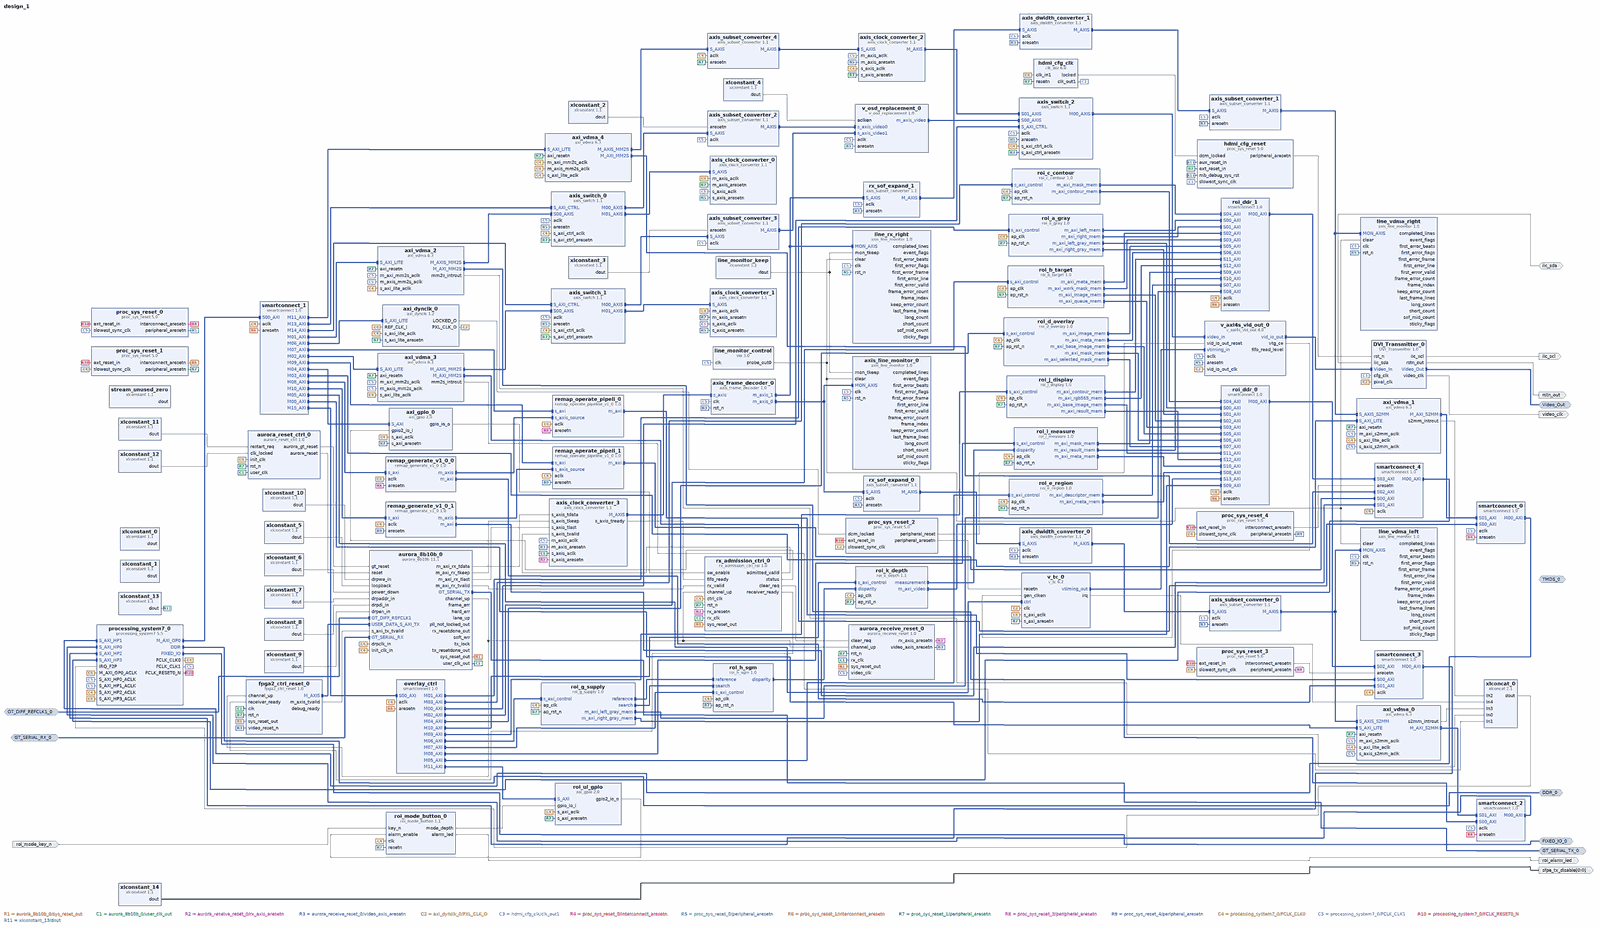
[diagram p0: block diagram of the top level, whole]
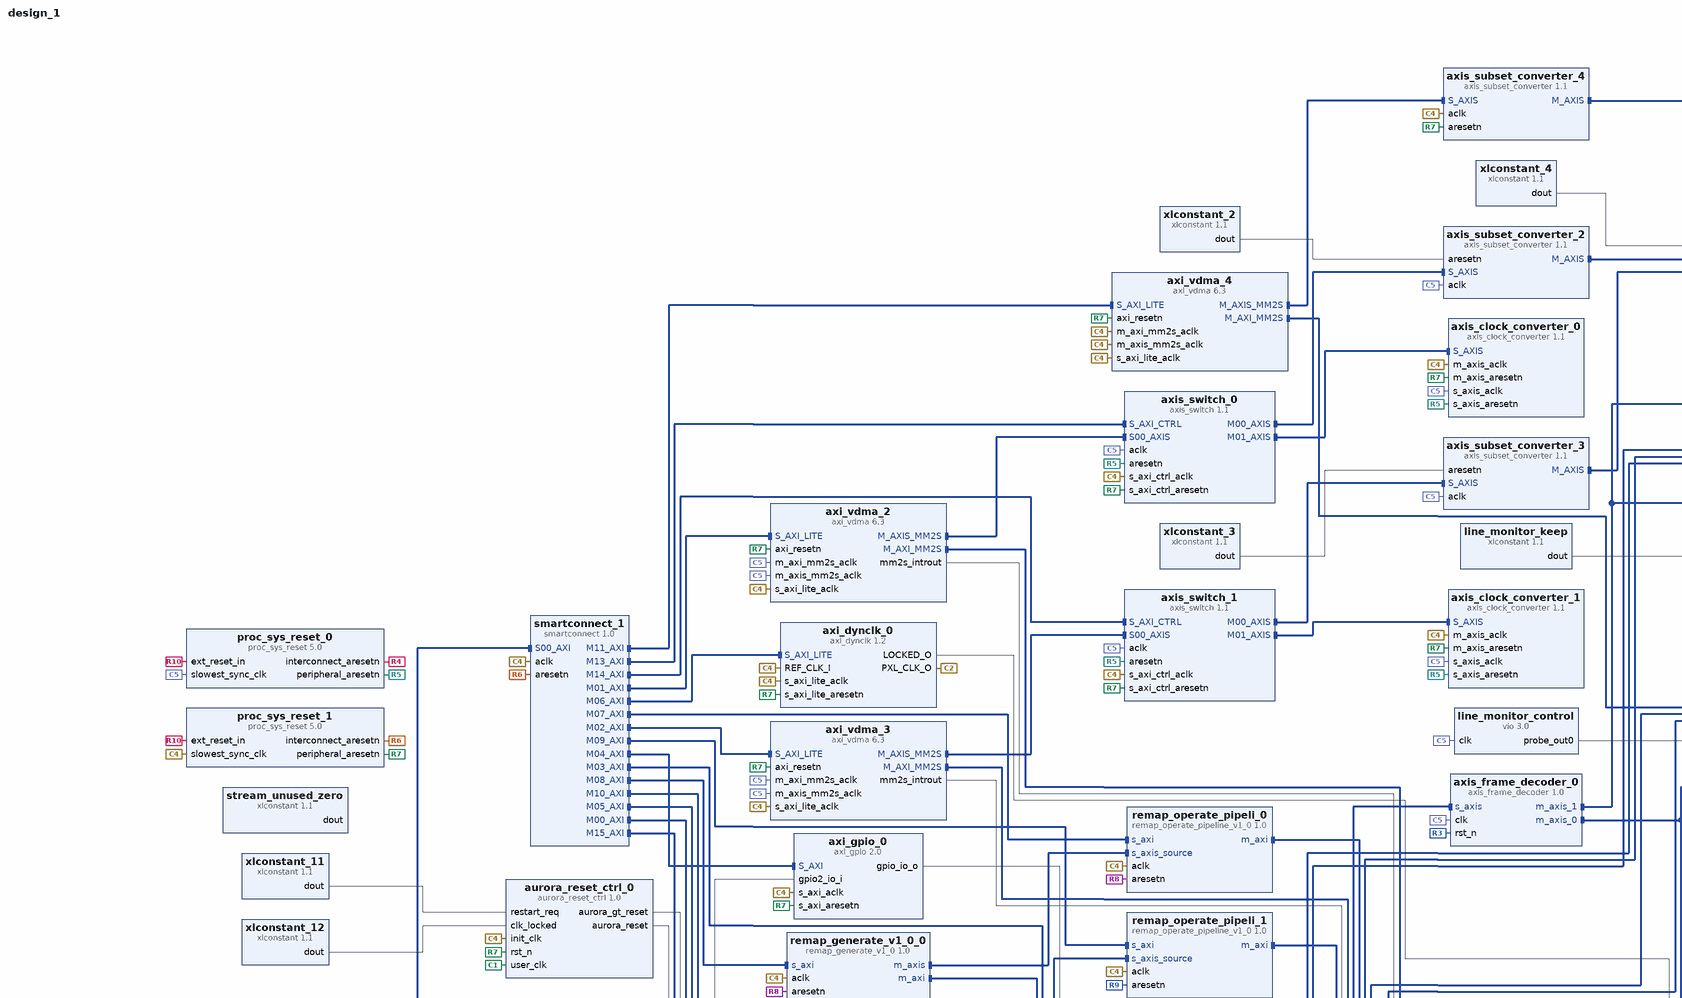
[diagram p1: block diagram of the top level, upper left part]
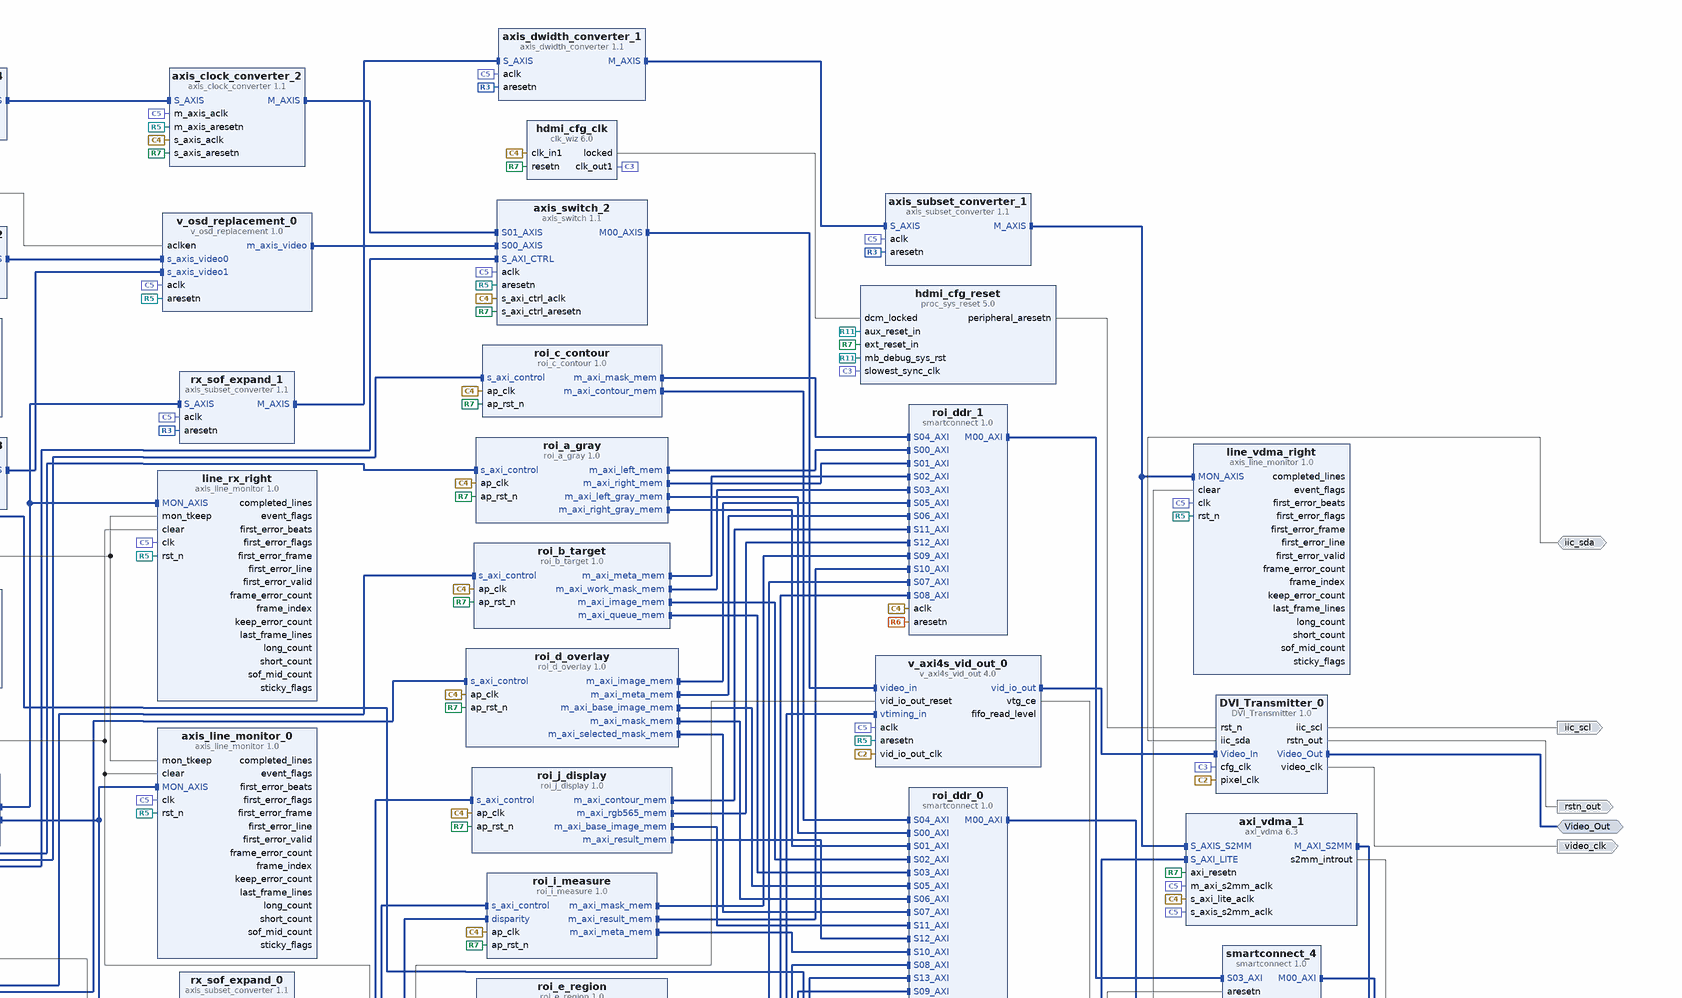
[diagram p2: block diagram of the top level, upper right part]
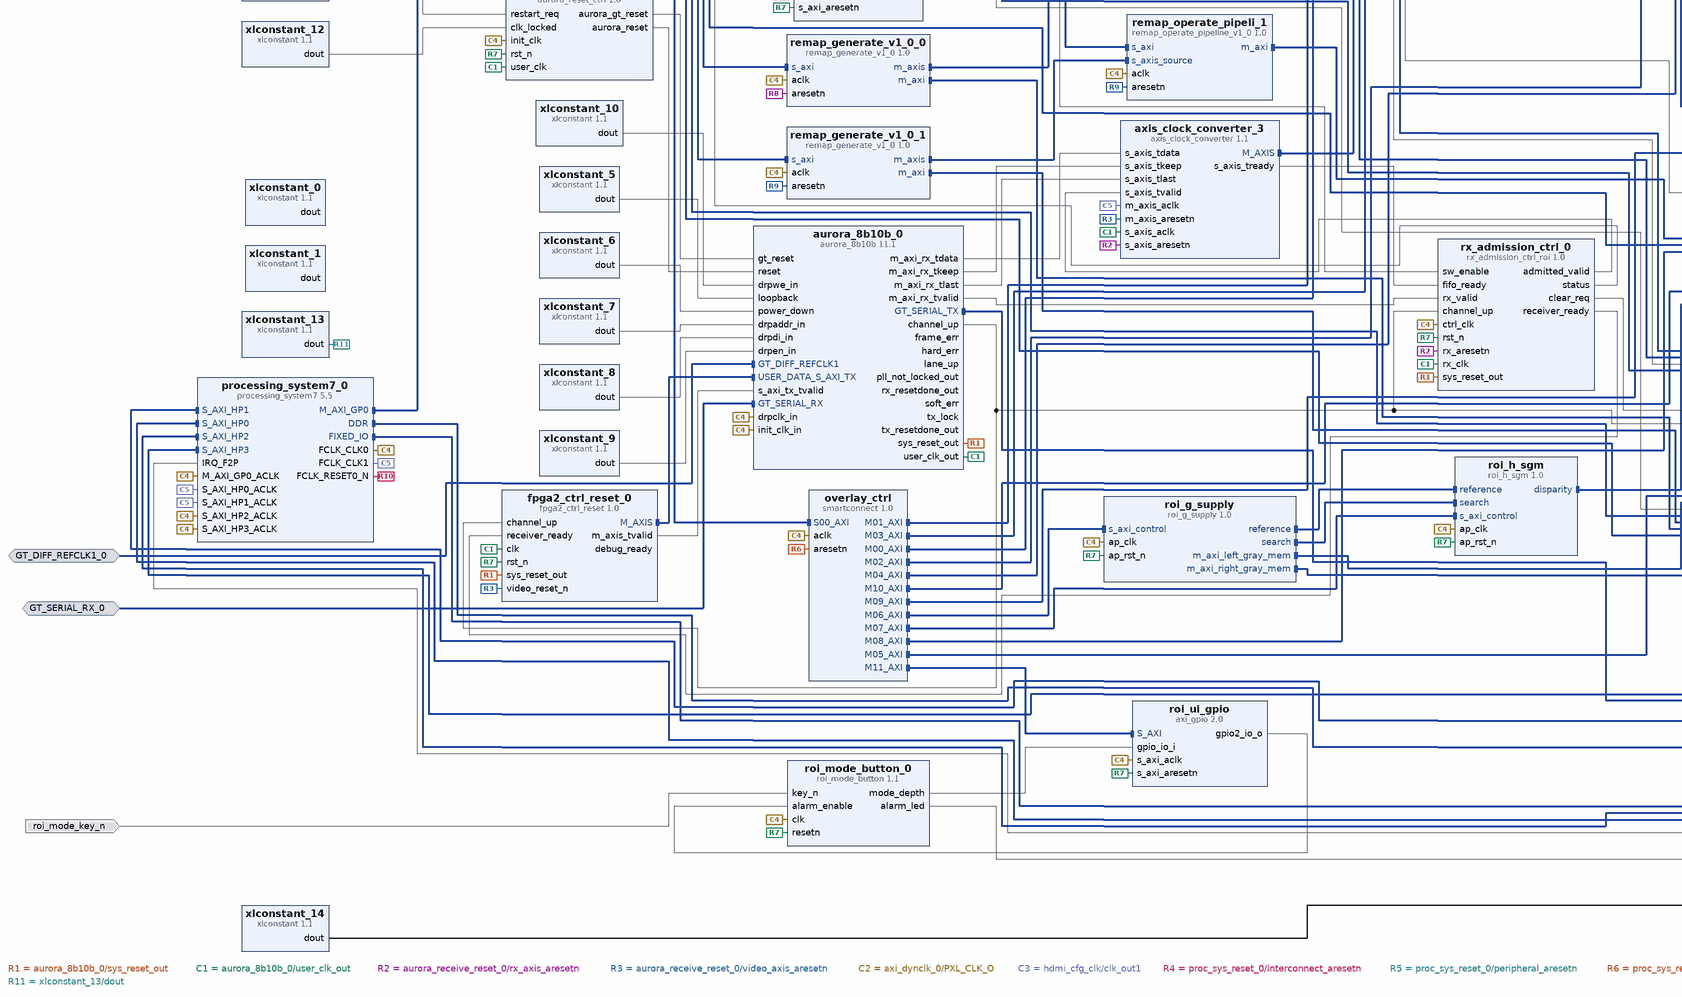
[diagram p3: block diagram of the top level, lower left part]
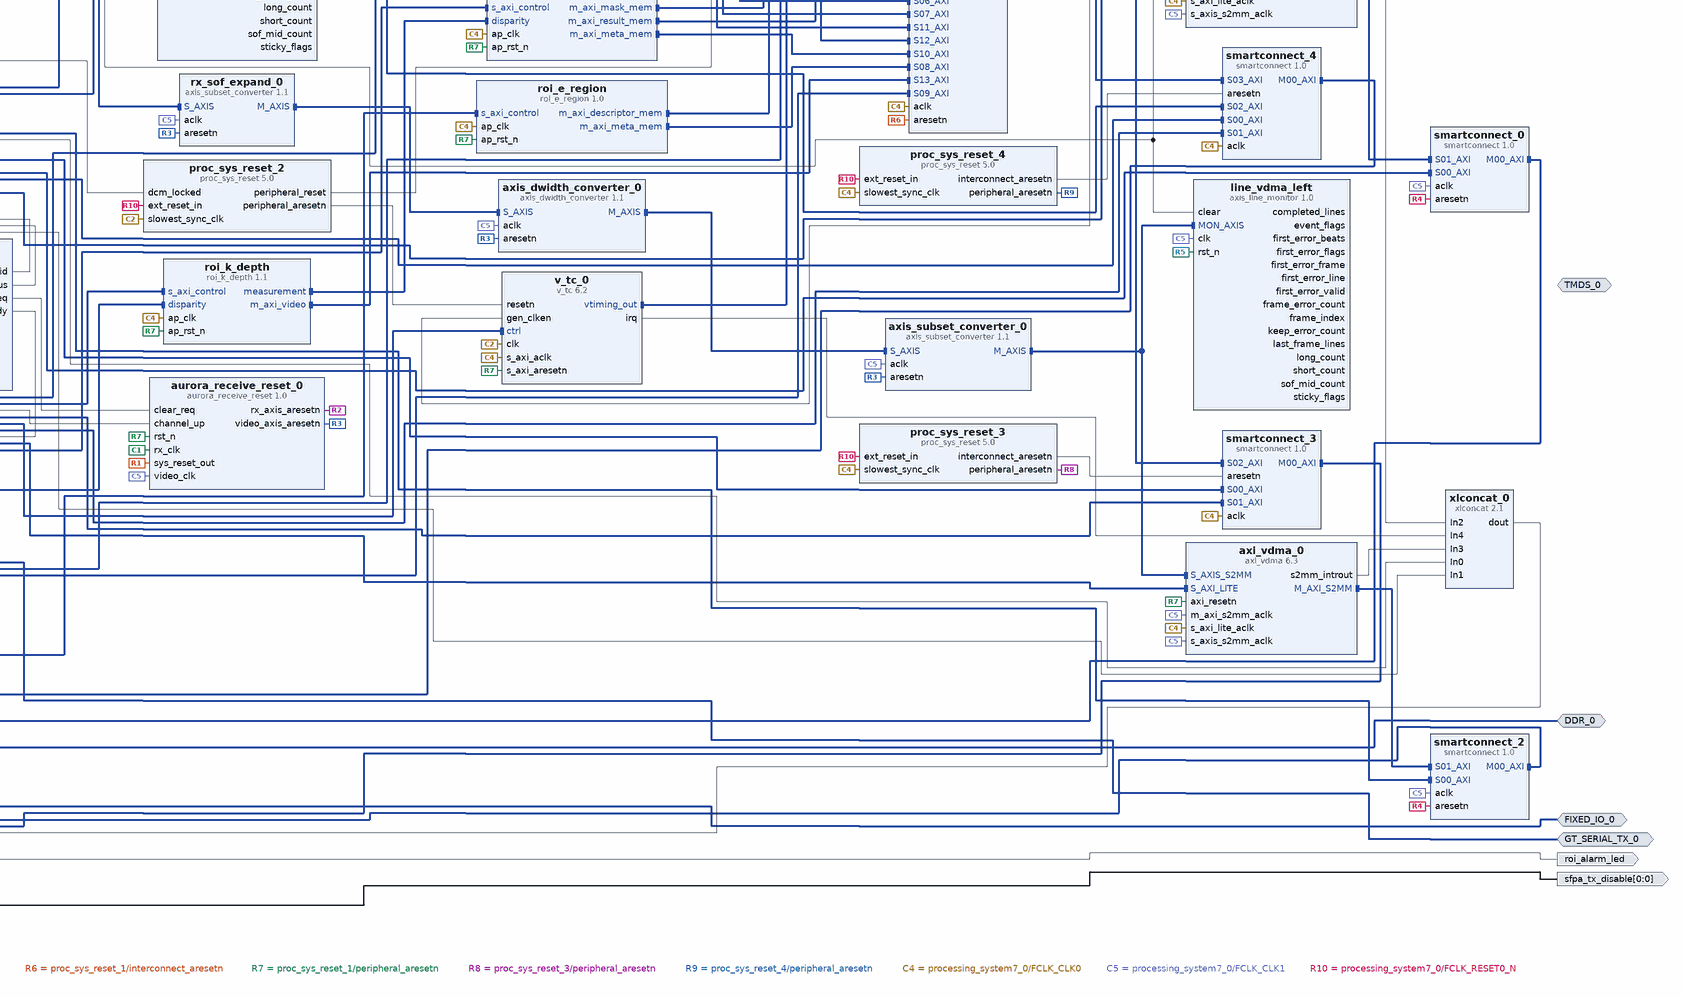
[diagram p4: block diagram of the top level, lower right part]
# Vivado block design design_1, xc7z035ffg900-2, Vivado 2023.2
create_bd_design design_1

create_bd_intf_port -mode Master -vlnv digilentinc.com:interface:tmds_rtl:1.0 TMDS_0
create_bd_intf_port -mode Master -vlnv xilinx.com:display_processing_system7:fixedio_rtl:1.0 FIXED_IO_0
create_bd_intf_port -mode Master -vlnv xilinx.com:interface:ddrx_rtl:1.0 DDR_0
create_bd_intf_port -mode Slave -vlnv xilinx.com:interface:diff_clock_rtl:1.0 GT_DIFF_REFCLK1_0
set_property -dict {CONFIG.FREQ_HZ 156250000} [get_bd_intf_ports GT_DIFF_REFCLK1_0]
create_bd_intf_port -mode Slave -vlnv xilinx.com:display_aurora:GT_Serial_Transceiver_Pins_RX_rtl:1.0 GT_SERIAL_RX_0
create_bd_intf_port -mode Master -vlnv xilinx.com:display_aurora:GT_Serial_Transceiver_Pins_TX_rtl:1.0 GT_SERIAL_TX_0
create_bd_intf_port -mode Master -vlnv xilinx.com:interface:vid_io_rtl:1.0 Video_Out
create_bd_port -dir O -from 0 -to 0 sfpa_tx_disable
create_bd_port -dir O -type clk video_clk
create_bd_port -dir O iic_scl
create_bd_port -dir IO iic_sda
create_bd_port -dir O -type rst rstn_out
create_bd_port -dir I roi_mode_key_n
create_bd_port -dir O roi_alarm_led

create_bd_cell -type ip -vlnv xilinx.com:ip:axis_subset_converter:1.1 axis_subset_converter_0
set_property -dict [list \
  CONFIG.M_TDATA_NUM_BYTES 4 \
  CONFIG.M_TUSER_WIDTH 1 \
  CONFIG.S_TDATA_NUM_BYTES 2 \
  CONFIG.TDATA_REMAP {8'b00000000,tdata[15:11],3'b000,tdata[10:5],2'b00,tdata[4:0],3'b000} \
  CONFIG.TKEEP_REMAP {2'b11,tkeep[1:0]} \
  CONFIG.TLAST_REMAP {tlast[0]} \
  CONFIG.TUSER_REMAP {tuser[0:0]} \
] [get_bd_cells axis_subset_converter_0]
create_bd_cell -type ip -vlnv xilinx.com:ip:axi_vdma:6.3 axi_vdma_0
set_property -dict [list \
  CONFIG.c_include_mm2s 0 \
  CONFIG.c_m_axi_s2mm_data_width 32 \
  CONFIG.c_s2mm_genlock_mode 0 \
  CONFIG.c_s2mm_linebuffer_depth 1024 \
  CONFIG.c_use_s2mm_fsync 0 \
] [get_bd_cells axi_vdma_0]
create_bd_cell -type ip -vlnv xilinx.com:ip:processing_system7:5.5 processing_system7_0
set_property -dict [list \
  CONFIG.PCW_APU_PERIPHERAL_FREQMHZ 666.666666 \
  CONFIG.PCW_CPU_CPU_6X4X_MAX_RANGE 800 \
  CONFIG.PCW_ENET0_PERIPHERAL_ENABLE 0 \
  CONFIG.PCW_EN_CLK1_PORT 1 \
  CONFIG.PCW_FCLK_CLK1_BUF TRUE \
  CONFIG.PCW_FPGA0_PERIPHERAL_FREQMHZ 100 \
  CONFIG.PCW_FPGA1_PERIPHERAL_FREQMHZ 150 \
  CONFIG.PCW_FPGA_FCLK1_ENABLE 1 \
  CONFIG.PCW_GPIO_EMIO_GPIO_ENABLE 1 \
  CONFIG.PCW_GPIO_EMIO_GPIO_IO 64 \
  CONFIG.PCW_GPIO_MIO_GPIO_ENABLE 0 \
  CONFIG.PCW_IRQ_F2P_INTR 1 \
  CONFIG.PCW_PERIPHERAL_BOARD_PRESET None \
  CONFIG.PCW_PRESET_BANK1_VOLTAGE {LVCMOS 3.3V} \
  CONFIG.PCW_QSPI_PERIPHERAL_ENABLE 0 \
  CONFIG.PCW_SD0_PERIPHERAL_ENABLE 0 \
  CONFIG.PCW_S_AXI_HP0_DATA_WIDTH 32 \
  CONFIG.PCW_S_AXI_HP1_DATA_WIDTH 32 \
  CONFIG.PCW_UART0_PERIPHERAL_ENABLE 1 \
  CONFIG.PCW_UART0_UART0_IO {MIO 14 .. 15} \
  CONFIG.PCW_UART1_PERIPHERAL_ENABLE 0 \
  CONFIG.PCW_UART_PERIPHERAL_FREQMHZ 100 \
  CONFIG.PCW_UIPARAM_DDR_FREQ_MHZ 533.333333 \
  CONFIG.PCW_UIPARAM_DDR_PARTNO {MT41J256M16 RE-125} \
  CONFIG.PCW_USB0_PERIPHERAL_ENABLE 0 \
  CONFIG.PCW_USE_FABRIC_INTERRUPT 1 \
  CONFIG.PCW_USE_S_AXI_HP0 1 \
  CONFIG.PCW_USE_S_AXI_HP1 1 \
  CONFIG.PCW_USE_S_AXI_HP2 1 \
  CONFIG.PCW_USE_S_AXI_HP3 1 \
] [get_bd_cells processing_system7_0]
# 349 more settings of processing_system7_0 are not shown: defaults, MIO pin electricals, DDR timing, and values the tool derives
create_bd_cell -type ip -vlnv xilinx.com:ip:axi_vdma:6.3 axi_vdma_1
set_property -dict [list \
  CONFIG.c_include_mm2s 0 \
  CONFIG.c_include_s2mm 1 \
  CONFIG.c_m_axi_s2mm_data_width 32 \
  CONFIG.c_s2mm_genlock_mode 0 \
  CONFIG.c_s2mm_linebuffer_depth 1024 \
  CONFIG.c_use_s2mm_fsync 0 \
] [get_bd_cells axi_vdma_1]
create_bd_cell -type ip -vlnv xilinx.com:ip:axis_subset_converter:1.1 axis_subset_converter_1
set_property -dict [list \
  CONFIG.M_TDATA_NUM_BYTES 4 \
  CONFIG.M_TUSER_WIDTH 1 \
  CONFIG.S_TDATA_NUM_BYTES 2 \
  CONFIG.TDATA_REMAP {8'b00000000,tdata[15:11],3'b000,tdata[10:5],2'b00,tdata[4:0],3'b000} \
  CONFIG.TKEEP_REMAP {2'b11,tkeep[1:0]} \
  CONFIG.TLAST_REMAP {tlast[0]} \
  CONFIG.TUSER_REMAP {tuser[0:0]} \
] [get_bd_cells axis_subset_converter_1]
create_bd_cell -type ip -vlnv xilinx.com:ip:smartconnect:1.0 smartconnect_0
set_property -dict {CONFIG.NUM_SI 2} [get_bd_cells smartconnect_0]
create_bd_cell -type ip -vlnv xilinx.com:ip:axi_vdma:6.3 axi_vdma_2
set_property -dict [list \
  CONFIG.c_include_mm2s 1 \
  CONFIG.c_include_s2mm 0 \
  CONFIG.c_mm2s_genlock_mode 1 \
  CONFIG.c_mm2s_max_burst_length 64 \
] [get_bd_cells axi_vdma_2]
create_bd_cell -type ip -vlnv xilinx.com:ip:axi_vdma:6.3 axi_vdma_3
set_property -dict [list \
  CONFIG.c_include_s2mm 0 \
  CONFIG.c_mm2s_genlock_mode 1 \
  CONFIG.c_mm2s_max_burst_length 64 \
] [get_bd_cells axi_vdma_3]
create_bd_cell -type ip -vlnv xilinx.com:ip:v_axi4s_vid_out:4.0 v_axi4s_vid_out_0
set_property -dict {CONFIG.C_ADDR_WIDTH 11 CONFIG.C_HAS_ASYNC_CLK 1} [get_bd_cells v_axi4s_vid_out_0]
create_bd_cell -type ip -vlnv xilinx.com:ip:axi_gpio:2.0 axi_gpio_0
set_property -dict [list \
  CONFIG.C_ALL_INPUTS_2 1 \
  CONFIG.C_ALL_OUTPUTS 1 \
  CONFIG.C_DOUT_DEFAULT 0x00000000 \
  CONFIG.C_GPIO2_WIDTH 32 \
  CONFIG.C_GPIO_WIDTH 1 \
  CONFIG.C_IS_DUAL 1 \
] [get_bd_cells axi_gpio_0]
create_bd_cell -type ip -vlnv xilinx.com:ip:proc_sys_reset:5.0 proc_sys_reset_0
create_bd_cell -type ip -vlnv xilinx.com:ip:smartconnect:1.0 smartconnect_1
set_property -dict {CONFIG.NUM_MI 16 CONFIG.NUM_SI 1} [get_bd_cells smartconnect_1]
create_bd_cell -type ip -vlnv xilinx.com:ip:xlconstant:1.1 xlconstant_0
create_bd_cell -type ip -vlnv xilinx.com:ip:xlconstant:1.1 xlconstant_1
create_bd_cell -type ip -vlnv xilinx.com:ip:proc_sys_reset:5.0 proc_sys_reset_1
create_bd_cell -type ip -vlnv digilentinc.com:ip:axi_dynclk:1.2 axi_dynclk_0
create_bd_cell -type ip -vlnv xilinx.com:ip:smartconnect:1.0 smartconnect_2
set_property -dict {CONFIG.NUM_SI 2} [get_bd_cells smartconnect_2]
create_bd_cell -type ip -vlnv xilinx.com:ip:v_tc:6.2 v_tc_0
set_property -dict {CONFIG.enable_detection false} [get_bd_cells v_tc_0]
create_bd_cell -type ip -vlnv xilinx.com:ip:axis_subset_converter:1.1 axis_subset_converter_2
set_property -dict [list \
  CONFIG.M_TDATA_NUM_BYTES 3 \
  CONFIG.S_TDATA_NUM_BYTES 4 \
  CONFIG.TDATA_REMAP {tdata[23:16],tdata[7:0],tdata[15:8]} \
  CONFIG.TKEEP_REMAP {tkeep[2:0]} \
  CONFIG.TLAST_REMAP {tlast[0]} \
  CONFIG.TUSER_REMAP {tuser[0:0]} \
] [get_bd_cells axis_subset_converter_2]
create_bd_cell -type ip -vlnv xilinx.com:ip:axis_subset_converter:1.1 axis_subset_converter_3
set_property -dict [list \
  CONFIG.M_TDATA_NUM_BYTES 3 \
  CONFIG.S_TDATA_NUM_BYTES 4 \
  CONFIG.TDATA_REMAP {tdata[23:16],tdata[7:0],tdata[15:8]} \
  CONFIG.TKEEP_REMAP {tkeep[2:0]} \
  CONFIG.TLAST_REMAP {tlast[0]} \
  CONFIG.TUSER_REMAP {tuser[0:0]} \
] [get_bd_cells axis_subset_converter_3]
create_bd_cell -type ip -vlnv xilinx.com:ip:xlconstant:1.1 xlconstant_2
create_bd_cell -type ip -vlnv xilinx.com:ip:xlconstant:1.1 xlconstant_3
create_bd_cell -type ip -vlnv xilinx.com:ip:xlconcat:2.1 xlconcat_0
set_property -dict {CONFIG.NUM_PORTS 5 CONFIG.dout_width 5} [get_bd_cells xlconcat_0]
create_bd_cell -type ip -vlnv xilinx.com:user:v_osd_replacement:1.0 v_osd_replacement_0
create_bd_cell -type ip -vlnv xilinx.com:ip:xlconstant:1.1 xlconstant_4
create_bd_cell -type ip -vlnv xilinx.com:ip:proc_sys_reset:5.0 proc_sys_reset_2
create_bd_cell -type ip -vlnv xilinx.com:ip:smartconnect:1.0 smartconnect_3
set_property -dict {CONFIG.NUM_SI 3} [get_bd_cells smartconnect_3]
create_bd_cell -type ip -vlnv xilinx.com:ip:proc_sys_reset:5.0 proc_sys_reset_3
create_bd_cell -type ip -vlnv xilinx.com:user:remap_generate_v1_0:1.0 remap_generate_v1_0_0
create_bd_cell -type ip -vlnv xilinx.com:user:remap_operate_pipeline_v1_0:1.0 remap_operate_pipeli_0
create_bd_cell -type ip -vlnv xilinx.com:user:remap_operate_pipeline_v1_0:1.0 remap_operate_pipeli_1
create_bd_cell -type ip -vlnv xilinx.com:user:remap_generate_v1_0:1.0 remap_generate_v1_0_1
create_bd_cell -type ip -vlnv xilinx.com:ip:smartconnect:1.0 smartconnect_4
set_property -dict {CONFIG.NUM_SI 4} [get_bd_cells smartconnect_4]
create_bd_cell -type ip -vlnv xilinx.com:ip:proc_sys_reset:5.0 proc_sys_reset_4
create_bd_cell -type ip -vlnv xilinx.com:ip:axis_clock_converter:1.1 axis_clock_converter_0
create_bd_cell -type ip -vlnv xilinx.com:ip:axis_clock_converter:1.1 axis_clock_converter_1
create_bd_cell -type ip -vlnv xilinx.com:ip:axis_switch:1.1 axis_switch_0
set_property -dict [list \
  CONFIG.DECODER_REG 1 \
  CONFIG.NUM_MI 2 \
  CONFIG.NUM_SI 1 \
  CONFIG.ROUTING_MODE 1 \
  CONFIG.TDATA_NUM_BYTES 4 \
] [get_bd_cells axis_switch_0]
create_bd_cell -type ip -vlnv xilinx.com:ip:axis_switch:1.1 axis_switch_1
set_property -dict [list \
  CONFIG.DECODER_REG 1 \
  CONFIG.NUM_MI 2 \
  CONFIG.NUM_SI 1 \
  CONFIG.ROUTING_MODE 1 \
  CONFIG.TDATA_NUM_BYTES 4 \
] [get_bd_cells axis_switch_1]
create_bd_cell -type ip -vlnv xilinx.com:ip:axi_vdma:6.3 axi_vdma_4
set_property -dict [list \
  CONFIG.c_include_s2mm 0 \
  CONFIG.c_m_axis_mm2s_tdata_width 16 \
  CONFIG.c_mm2s_genlock_mode 0 \
  CONFIG.c_mm2s_max_burst_length 64 \
] [get_bd_cells axi_vdma_4]
create_bd_cell -type ip -vlnv xilinx.com:ip:axis_clock_converter:1.1 axis_clock_converter_2
create_bd_cell -type ip -vlnv xilinx.com:ip:axis_subset_converter:1.1 axis_subset_converter_4
set_property -dict [list \
  CONFIG.M_TDATA_NUM_BYTES 3 \
  CONFIG.S_TDATA_NUM_BYTES 2 \
  CONFIG.TDATA_REMAP {tdata[15:11],tdata[15:13],tdata[10:5],tdata[10:9],tdata[4:0],tdata[4:2]} \
  CONFIG.TLAST_REMAP {tlast[0]} \
  CONFIG.TUSER_REMAP {tuser[0:0]} \
] [get_bd_cells axis_subset_converter_4]
create_bd_cell -type ip -vlnv xilinx.com:ip:axis_switch:1.1 axis_switch_2
set_property -dict {CONFIG.ROUTING_MODE 1} [get_bd_cells axis_switch_2]
create_bd_cell -type ip -vlnv xilinx.com:ip:aurora_8b10b:11.1 aurora_8b10b_0
set_property -dict [list \
  CONFIG.C_DRP_IF true \
  CONFIG.C_LANE_WIDTH 4 \
  CONFIG.C_LINE_RATE 2.5 \
  CONFIG.C_REFCLK_FREQUENCY 156.250 \
  CONFIG.SINGLEEND_INITCLK true \
  CONFIG.SupportLevel 1 \
] [get_bd_cells aurora_8b10b_0]
create_bd_cell -type ip -vlnv xilinx.com:user:axis_frame_decoder:1.0 axis_frame_decoder_0
create_bd_cell -type ip -vlnv xilinx.com:ip:axis_clock_converter:1.1 axis_clock_converter_3
set_property -dict {CONFIG.HAS_TLAST 1 CONFIG.IS_ACLK_ASYNC 1 CONFIG.TDATA_NUM_BYTES 4} [get_bd_cells axis_clock_converter_3]
create_bd_cell -type ip -vlnv xilinx.com:user:aurora_reset_ctrl:1.0 aurora_reset_ctrl_0
create_bd_cell -type ip -vlnv xilinx.com:ip:xlconstant:1.1 xlconstant_5
set_property -dict {CONFIG.CONST_VAL 0 CONFIG.CONST_WIDTH 3} [get_bd_cells xlconstant_5]
create_bd_cell -type ip -vlnv xilinx.com:ip:xlconstant:1.1 xlconstant_6
set_property -dict {CONFIG.CONST_VAL 0} [get_bd_cells xlconstant_6]
create_bd_cell -type ip -vlnv xilinx.com:ip:xlconstant:1.1 xlconstant_7
set_property -dict {CONFIG.CONST_VAL 0 CONFIG.CONST_WIDTH 9} [get_bd_cells xlconstant_7]
create_bd_cell -type ip -vlnv xilinx.com:ip:xlconstant:1.1 xlconstant_8
set_property -dict {CONFIG.CONST_VAL 0 CONFIG.CONST_WIDTH 16} [get_bd_cells xlconstant_8]
create_bd_cell -type ip -vlnv xilinx.com:ip:xlconstant:1.1 xlconstant_9
set_property -dict {CONFIG.CONST_VAL 0} [get_bd_cells xlconstant_9]
create_bd_cell -type ip -vlnv xilinx.com:ip:xlconstant:1.1 xlconstant_10
set_property -dict {CONFIG.CONST_VAL 0} [get_bd_cells xlconstant_10]
create_bd_cell -type ip -vlnv xilinx.com:ip:xlconstant:1.1 xlconstant_11
set_property -dict {CONFIG.CONST_VAL 0} [get_bd_cells xlconstant_11]
create_bd_cell -type ip -vlnv xilinx.com:ip:xlconstant:1.1 xlconstant_12
create_bd_cell -type ip -vlnv xilinx.com:user:aurora_receive_reset:1.0 aurora_receive_reset_0
create_bd_cell -type ip -vlnv xilinx.com:ip:xlconstant:1.1 xlconstant_13
set_property -dict {CONFIG.CONST_VAL 0} [get_bd_cells xlconstant_13]
create_bd_cell -type ip -vlnv xilinx.com:ip:axis_dwidth_converter:1.1 axis_dwidth_converter_0
set_property -dict [list \
  CONFIG.HAS_TKEEP 1 \
  CONFIG.HAS_TLAST 1 \
  CONFIG.M_TDATA_NUM_BYTES 2 \
  CONFIG.S_TDATA_NUM_BYTES 4 \
  CONFIG.TUSER_BITS_PER_BYTE 1 \
] [get_bd_cells axis_dwidth_converter_0]
create_bd_cell -type ip -vlnv xilinx.com:ip:axis_dwidth_converter:1.1 axis_dwidth_converter_1
set_property -dict [list \
  CONFIG.HAS_TKEEP 1 \
  CONFIG.HAS_TLAST 1 \
  CONFIG.M_TDATA_NUM_BYTES 2 \
  CONFIG.S_TDATA_NUM_BYTES 4 \
  CONFIG.TUSER_BITS_PER_BYTE 1 \
] [get_bd_cells axis_dwidth_converter_1]
create_bd_cell -type ip -vlnv xilinx.com:ip:xlconstant:1.1 xlconstant_14
set_property -dict {CONFIG.CONST_VAL 0} [get_bd_cells xlconstant_14]
create_bd_cell -type ip -vlnv openedv.com:user:DVI_Transmitter:1.0 DVI_Transmitter_0
create_bd_cell -type ip -vlnv xilinx.com:ip:clk_wiz:6.0 hdmi_cfg_clk
set_property -dict [list \
  CONFIG.CLKOUT1_REQUESTED_OUT_FREQ 10.000 \
  CONFIG.PRIM_IN_FREQ 100.000 \
  CONFIG.PRIM_SOURCE No_buffer \
  CONFIG.RESET_TYPE ACTIVE_LOW \
] [get_bd_cells hdmi_cfg_clk]
create_bd_cell -type ip -vlnv xilinx.com:ip:proc_sys_reset:5.0 hdmi_cfg_reset
set_property -dict {CONFIG.C_AUX_RESET_HIGH 1} [get_bd_cells hdmi_cfg_reset]
create_bd_cell -type ip -vlnv xilinx.com:ip:axis_subset_converter:1.1 rx_sof_expand_0
set_property -dict [list \
  CONFIG.M_HAS_TLAST 1 \
  CONFIG.M_TDATA_NUM_BYTES 4 \
  CONFIG.M_TUSER_WIDTH 4 \
  CONFIG.S_HAS_TLAST 1 \
  CONFIG.S_TDATA_NUM_BYTES 4 \
  CONFIG.S_TUSER_WIDTH 1 \
  CONFIG.TUSER_REMAP {3'b000,tuser[0]} \
] [get_bd_cells rx_sof_expand_0]
create_bd_cell -type ip -vlnv xilinx.com:ip:axis_subset_converter:1.1 rx_sof_expand_1
set_property -dict [list \
  CONFIG.M_HAS_TLAST 1 \
  CONFIG.M_TDATA_NUM_BYTES 4 \
  CONFIG.M_TUSER_WIDTH 4 \
  CONFIG.S_HAS_TLAST 1 \
  CONFIG.S_TDATA_NUM_BYTES 4 \
  CONFIG.S_TUSER_WIDTH 1 \
  CONFIG.TUSER_REMAP {3'b000,tuser[0]} \
] [get_bd_cells rx_sof_expand_1]
create_bd_cell -type ip -vlnv xilinx.com:ip:vio:3.0 line_monitor_control
set_property -dict [list \
  CONFIG.C_NUM_PROBE_IN 0 \
  CONFIG.C_NUM_PROBE_OUT 1 \
  CONFIG.C_PROBE_OUT0_INIT_VAL 0000 \
  CONFIG.C_PROBE_OUT0_WIDTH 1 \
] [get_bd_cells line_monitor_control]
create_bd_cell -type ip -vlnv xilinx.com:ip:xlconstant:1.1 line_monitor_keep
set_property -dict {CONFIG.CONST_VAL 15 CONFIG.CONST_WIDTH 4} [get_bd_cells line_monitor_keep]
create_bd_cell -type ip -vlnv user.org:user:axis_line_monitor:1.0 axis_line_monitor_0
set_property -dict [list \
  CONFIG.CHECK_KEEP 0 \
  CONFIG.DATA_BYTES 4 \
  CONFIG.EXPECTED_BEATS 640 \
  CONFIG.EXPECTED_LINES 720 \
  CONFIG.IDLE_TIMEOUT_CYCLES 0 \
  CONFIG.USER_WIDTH 1 \
] [get_bd_cells axis_line_monitor_0]
create_bd_cell -type ip -vlnv user.org:user:axis_line_monitor:1.0 line_rx_right
set_property -dict [list \
  CONFIG.CHECK_KEEP 0 \
  CONFIG.DATA_BYTES 4 \
  CONFIG.EXPECTED_BEATS 640 \
  CONFIG.EXPECTED_LINES 720 \
  CONFIG.IDLE_TIMEOUT_CYCLES 0 \
  CONFIG.USER_WIDTH 1 \
] [get_bd_cells line_rx_right]
create_bd_cell -type ip -vlnv user.org:user:axis_line_monitor:1.0 line_vdma_left
set_property -dict [list \
  CONFIG.CHECK_KEEP 1 \
  CONFIG.DATA_BYTES 4 \
  CONFIG.EXPECTED_BEATS 1280 \
  CONFIG.EXPECTED_LINES 720 \
  CONFIG.IDLE_TIMEOUT_CYCLES 0 \
  CONFIG.USER_WIDTH 1 \
] [get_bd_cells line_vdma_left]
create_bd_cell -type ip -vlnv user.org:user:axis_line_monitor:1.0 line_vdma_right
set_property -dict [list \
  CONFIG.CHECK_KEEP 1 \
  CONFIG.DATA_BYTES 4 \
  CONFIG.EXPECTED_BEATS 1280 \
  CONFIG.EXPECTED_LINES 720 \
  CONFIG.IDLE_TIMEOUT_CYCLES 0 \
  CONFIG.USER_WIDTH 1 \
] [get_bd_cells line_vdma_right]
create_bd_cell -type ip -vlnv xilinx.com:user:fpga2_ctrl_reset:1.0 fpga2_ctrl_reset_0
create_bd_cell -type ip -vlnv xilinx.com:ip:smartconnect:1.0 overlay_ctrl
set_property -dict {CONFIG.NUM_MI 12 CONFIG.NUM_SI 1} [get_bd_cells overlay_ctrl]
create_bd_cell -type ip -vlnv xilinx.com:ip:xlconstant:1.1 stream_unused_zero
set_property -dict {CONFIG.CONST_VAL 0 CONFIG.CONST_WIDTH 1} [get_bd_cells stream_unused_zero]
create_bd_cell -type ip -vlnv stereo.local:user:roi_a_gray:1.0 roi_a_gray
create_bd_cell -type ip -vlnv stereo.local:user:roi_b_target:1.0 roi_b_target
create_bd_cell -type ip -vlnv stereo.local:user:roi_c_contour:1.0 roi_c_contour
create_bd_cell -type ip -vlnv stereo.local:user:roi_d_overlay:1.0 roi_d_overlay
create_bd_cell -type ip -vlnv stereo.local:user:roi_e_region:1.0 roi_e_region
create_bd_cell -type ip -vlnv stereo.local:user:roi_g_supply:1.0 roi_g_supply
create_bd_cell -type ip -vlnv stereo.local:user:roi_h_sgm:1.0 roi_h_sgm
create_bd_cell -type ip -vlnv stereo.local:user:roi_i_measure:1.0 roi_i_measure
create_bd_cell -type ip -vlnv stereo.local:user:roi_j_display:1.0 roi_j_display
create_bd_cell -type ip -vlnv xilinx.com:ip:smartconnect:1.0 roi_ddr_0
set_property -dict {CONFIG.NUM_MI 1 CONFIG.NUM_SI 14} [get_bd_cells roi_ddr_0]
create_bd_cell -type ip -vlnv xilinx.com:ip:smartconnect:1.0 roi_ddr_1
set_property -dict {CONFIG.NUM_MI 1 CONFIG.NUM_SI 13} [get_bd_cells roi_ddr_1]
create_bd_cell -type ip -vlnv stereo.local:user:rx_admission_ctrl_roi:1.0 rx_admission_ctrl_0
create_bd_cell -type ip -vlnv stereo.local:user:roi_k_depth:1.1 roi_k_depth
create_bd_cell -type ip -vlnv xilinx.com:ip:axi_gpio:2.0 roi_ui_gpio
set_property -dict [list \
  CONFIG.C_ALL_INPUTS 1 \
  CONFIG.C_ALL_OUTPUTS_2 1 \
  CONFIG.C_DOUT_DEFAULT_2 0x00000000 \
  CONFIG.C_GPIO2_WIDTH 1 \
  CONFIG.C_GPIO_WIDTH 2 \
  CONFIG.C_IS_DUAL 1 \
] [get_bd_cells roi_ui_gpio]
create_bd_cell -type ip -vlnv stereo.local:user:roi_mode_button:1.1 roi_mode_button_0

# ---- connections ----

connect_bd_intf_net [get_bd_intf_ports Video_Out] [get_bd_intf_pins DVI_Transmitter_0/Video_Out]
connect_bd_intf_net -intf_net GT_DIFF_REFCLK1_0_1 [get_bd_intf_ports GT_DIFF_REFCLK1_0] [get_bd_intf_pins aurora_8b10b_0/GT_DIFF_REFCLK1]
connect_bd_intf_net -intf_net GT_SERIAL_RX_0_1 [get_bd_intf_ports GT_SERIAL_RX_0] [get_bd_intf_pins aurora_8b10b_0/GT_SERIAL_RX]
connect_bd_intf_net [get_bd_intf_ports GT_SERIAL_TX_0] [get_bd_intf_pins aurora_8b10b_0/GT_SERIAL_TX]
connect_bd_intf_net [get_bd_intf_pins axi_vdma_0/M_AXI_S2MM] [get_bd_intf_pins smartconnect_2/S01_AXI]
connect_bd_intf_net [get_bd_intf_pins axi_vdma_1/M_AXI_S2MM] [get_bd_intf_pins smartconnect_0/S01_AXI]
connect_bd_intf_net [get_bd_intf_pins axi_vdma_2/M_AXIS_MM2S] [get_bd_intf_pins axis_switch_0/S00_AXIS]
connect_bd_intf_net [get_bd_intf_pins axi_vdma_2/M_AXI_MM2S] [get_bd_intf_pins smartconnect_2/S00_AXI]
connect_bd_intf_net [get_bd_intf_pins axi_vdma_3/M_AXIS_MM2S] [get_bd_intf_pins axis_switch_1/S00_AXIS]
connect_bd_intf_net [get_bd_intf_pins axi_vdma_3/M_AXI_MM2S] [get_bd_intf_pins smartconnect_0/S00_AXI]
connect_bd_intf_net [get_bd_intf_pins axi_vdma_4/M_AXIS_MM2S] [get_bd_intf_pins axis_subset_converter_4/S_AXIS]
connect_bd_intf_net [get_bd_intf_pins axi_vdma_4/M_AXI_MM2S] [get_bd_intf_pins smartconnect_4/S02_AXI]
connect_bd_intf_net -intf_net axi_vdma_5_M_AXI_MM2S [get_bd_intf_pins roi_ddr_1/M00_AXI] [get_bd_intf_pins smartconnect_4/S03_AXI]
connect_bd_intf_net [get_bd_intf_pins axis_clock_converter_2/M_AXIS] [get_bd_intf_pins axis_switch_2/S01_AXIS]
connect_bd_intf_net [get_bd_intf_pins axis_clock_converter_3/M_AXIS] [get_bd_intf_pins axis_frame_decoder_0/s_axis]
connect_bd_intf_net [get_bd_intf_pins axis_dwidth_converter_0/M_AXIS] [get_bd_intf_pins axis_subset_converter_0/S_AXIS]
connect_bd_intf_net [get_bd_intf_pins axis_dwidth_converter_1/M_AXIS] [get_bd_intf_pins axis_subset_converter_1/S_AXIS]
connect_bd_intf_net [get_bd_intf_pins axis_frame_decoder_0/m_axis_0] [get_bd_intf_pins rx_sof_expand_0/S_AXIS]
connect_bd_intf_net [get_bd_intf_pins axis_frame_decoder_0/m_axis_0] [get_bd_intf_pins axis_line_monitor_0/MON_AXIS]
connect_bd_intf_net [get_bd_intf_pins axis_frame_decoder_0/m_axis_1] [get_bd_intf_pins rx_sof_expand_1/S_AXIS]
connect_bd_intf_net [get_bd_intf_pins axis_frame_decoder_0/m_axis_1] [get_bd_intf_pins line_rx_right/MON_AXIS]
connect_bd_intf_net [get_bd_intf_pins axis_subset_converter_0/M_AXIS] [get_bd_intf_pins axi_vdma_0/S_AXIS_S2MM]
connect_bd_intf_net [get_bd_intf_pins axis_subset_converter_0/M_AXIS] [get_bd_intf_pins line_vdma_left/MON_AXIS]
connect_bd_intf_net [get_bd_intf_pins axis_subset_converter_1/M_AXIS] [get_bd_intf_pins axi_vdma_1/S_AXIS_S2MM]
connect_bd_intf_net [get_bd_intf_pins axis_subset_converter_1/M_AXIS] [get_bd_intf_pins line_vdma_right/MON_AXIS]
connect_bd_intf_net [get_bd_intf_pins axis_subset_converter_2/M_AXIS] [get_bd_intf_pins v_osd_replacement_0/s_axis_video0]
connect_bd_intf_net [get_bd_intf_pins axis_subset_converter_3/M_AXIS] [get_bd_intf_pins v_osd_replacement_0/s_axis_video1]
connect_bd_intf_net [get_bd_intf_pins axis_subset_converter_4/M_AXIS] [get_bd_intf_pins axis_clock_converter_2/S_AXIS]
connect_bd_intf_net [get_bd_intf_pins axis_switch_0/M00_AXIS] [get_bd_intf_pins axis_subset_converter_2/S_AXIS]
connect_bd_intf_net [get_bd_intf_pins axis_switch_0/M01_AXIS] [get_bd_intf_pins axis_clock_converter_0/S_AXIS]
connect_bd_intf_net [get_bd_intf_pins axis_switch_1/M00_AXIS] [get_bd_intf_pins axis_subset_converter_3/S_AXIS]
connect_bd_intf_net [get_bd_intf_pins axis_switch_1/M01_AXIS] [get_bd_intf_pins axis_clock_converter_1/S_AXIS]
connect_bd_intf_net [get_bd_intf_pins axis_switch_2/M00_AXIS] [get_bd_intf_pins v_axi4s_vid_out_0/video_in]
connect_bd_intf_net [get_bd_intf_pins fpga2_ctrl_reset_0/M_AXIS] [get_bd_intf_pins aurora_8b10b_0/USER_DATA_S_AXI_TX]
connect_bd_intf_net [get_bd_intf_pins overlay_ctrl/M00_AXI] [get_bd_intf_pins axis_switch_2/S_AXI_CTRL]
connect_bd_intf_net [get_bd_intf_pins overlay_ctrl/M01_AXI] [get_bd_intf_pins roi_a_gray/s_axi_control]
connect_bd_intf_net [get_bd_intf_pins overlay_ctrl/M02_AXI] [get_bd_intf_pins roi_b_target/s_axi_control]
connect_bd_intf_net [get_bd_intf_pins overlay_ctrl/M03_AXI] [get_bd_intf_pins roi_c_contour/s_axi_control]
connect_bd_intf_net [get_bd_intf_pins overlay_ctrl/M04_AXI] [get_bd_intf_pins roi_d_overlay/s_axi_control]
connect_bd_intf_net [get_bd_intf_pins overlay_ctrl/M05_AXI] [get_bd_intf_pins roi_e_region/s_axi_control]
connect_bd_intf_net [get_bd_intf_pins overlay_ctrl/M06_AXI] [get_bd_intf_pins roi_g_supply/s_axi_control]
connect_bd_intf_net [get_bd_intf_pins overlay_ctrl/M07_AXI] [get_bd_intf_pins roi_h_sgm/s_axi_control]
connect_bd_intf_net [get_bd_intf_pins overlay_ctrl/M08_AXI] [get_bd_intf_pins roi_i_measure/s_axi_control]
connect_bd_intf_net [get_bd_intf_pins overlay_ctrl/M09_AXI] [get_bd_intf_pins roi_j_display/s_axi_control]
connect_bd_intf_net [get_bd_intf_pins overlay_ctrl/M10_AXI] [get_bd_intf_pins roi_k_depth/s_axi_control]
connect_bd_intf_net [get_bd_intf_pins overlay_ctrl/M11_AXI] [get_bd_intf_pins roi_ui_gpio/S_AXI]
connect_bd_intf_net [get_bd_intf_ports DDR_0] [get_bd_intf_pins processing_system7_0/DDR]
connect_bd_intf_net [get_bd_intf_ports FIXED_IO_0] [get_bd_intf_pins processing_system7_0/FIXED_IO]
connect_bd_intf_net [get_bd_intf_pins processing_system7_0/M_AXI_GP0] [get_bd_intf_pins smartconnect_1/S00_AXI]
connect_bd_intf_net [get_bd_intf_pins remap_generate_v1_0_0/m_axi] [get_bd_intf_pins smartconnect_3/S01_AXI]
connect_bd_intf_net [get_bd_intf_pins remap_operate_pipeli_0/s_axis_source] [get_bd_intf_pins remap_generate_v1_0_0/m_axis]
connect_bd_intf_net [get_bd_intf_pins remap_generate_v1_0_1/m_axi] [get_bd_intf_pins smartconnect_4/S01_AXI]
connect_bd_intf_net [get_bd_intf_pins remap_generate_v1_0_1/m_axis] [get_bd_intf_pins remap_operate_pipeli_1/s_axis_source]
connect_bd_intf_net [get_bd_intf_pins smartconnect_3/S00_AXI] [get_bd_intf_pins remap_operate_pipeli_0/m_axi]
connect_bd_intf_net [get_bd_intf_pins remap_operate_pipeli_1/m_axi] [get_bd_intf_pins smartconnect_4/S00_AXI]
connect_bd_intf_net [get_bd_intf_pins roi_a_gray/m_axi_left_gray_mem] [get_bd_intf_pins roi_ddr_0/S00_AXI]
connect_bd_intf_net [get_bd_intf_pins roi_a_gray/m_axi_left_mem] [get_bd_intf_pins roi_ddr_1/S00_AXI]
connect_bd_intf_net [get_bd_intf_pins roi_a_gray/m_axi_right_gray_mem] [get_bd_intf_pins roi_ddr_0/S01_AXI]
connect_bd_intf_net [get_bd_intf_pins roi_a_gray/m_axi_right_mem] [get_bd_intf_pins roi_ddr_1/S01_AXI]
connect_bd_intf_net [get_bd_intf_pins roi_b_target/m_axi_image_mem] [get_bd_intf_pins roi_ddr_0/S02_AXI]
connect_bd_intf_net [get_bd_intf_pins roi_b_target/m_axi_meta_mem] [get_bd_intf_pins roi_ddr_1/S02_AXI]
connect_bd_intf_net [get_bd_intf_pins roi_b_target/m_axi_queue_mem] [get_bd_intf_pins roi_ddr_0/S03_AXI]
connect_bd_intf_net [get_bd_intf_pins roi_b_target/m_axi_work_mask_mem] [get_bd_intf_pins roi_ddr_1/S03_AXI]
connect_bd_intf_net [get_bd_intf_pins roi_c_contour/m_axi_contour_mem] [get_bd_intf_pins roi_ddr_0/S04_AXI]
connect_bd_intf_net [get_bd_intf_pins roi_c_contour/m_axi_mask_mem] [get_bd_intf_pins roi_ddr_1/S04_AXI]
connect_bd_intf_net [get_bd_intf_pins roi_d_overlay/m_axi_base_image_mem] [get_bd_intf_pins roi_ddr_0/S05_AXI]
connect_bd_intf_net [get_bd_intf_pins roi_d_overlay/m_axi_image_mem] [get_bd_intf_pins roi_ddr_1/S05_AXI]
connect_bd_intf_net [get_bd_intf_pins roi_d_overlay/m_axi_mask_mem] [get_bd_intf_pins roi_ddr_0/S06_AXI]
connect_bd_intf_net [get_bd_intf_pins roi_d_overlay/m_axi_meta_mem] [get_bd_intf_pins roi_ddr_1/S06_AXI]
connect_bd_intf_net [get_bd_intf_pins roi_d_overlay/m_axi_selected_mask_mem] [get_bd_intf_pins roi_ddr_0/S07_AXI]
connect_bd_intf_net [get_bd_intf_pins roi_e_region/m_axi_descriptor_mem] [get_bd_intf_pins roi_ddr_1/S07_AXI]
connect_bd_intf_net [get_bd_intf_pins roi_e_region/m_axi_meta_mem] [get_bd_intf_pins roi_ddr_0/S08_AXI]
connect_bd_intf_net [get_bd_intf_pins roi_g_supply/m_axi_left_gray_mem] [get_bd_intf_pins roi_ddr_1/S08_AXI]
connect_bd_intf_net [get_bd_intf_pins roi_g_supply/m_axi_right_gray_mem] [get_bd_intf_pins roi_ddr_0/S09_AXI]
connect_bd_intf_net [get_bd_intf_pins roi_g_supply/reference] [get_bd_intf_pins roi_h_sgm/reference]
connect_bd_intf_net [get_bd_intf_pins roi_g_supply/search] [get_bd_intf_pins roi_h_sgm/search]
connect_bd_intf_net [get_bd_intf_pins roi_h_sgm/disparity] [get_bd_intf_pins roi_k_depth/disparity]
connect_bd_intf_net [get_bd_intf_pins roi_i_measure/m_axi_mask_mem] [get_bd_intf_pins roi_ddr_1/S09_AXI]
connect_bd_intf_net [get_bd_intf_pins roi_i_measure/m_axi_meta_mem] [get_bd_intf_pins roi_ddr_0/S10_AXI]
connect_bd_intf_net [get_bd_intf_pins roi_i_measure/m_axi_result_mem] [get_bd_intf_pins roi_ddr_1/S10_AXI]
connect_bd_intf_net [get_bd_intf_pins roi_j_display/m_axi_base_image_mem] [get_bd_intf_pins roi_ddr_0/S11_AXI]
connect_bd_intf_net [get_bd_intf_pins roi_j_display/m_axi_contour_mem] [get_bd_intf_pins roi_ddr_1/S11_AXI]
connect_bd_intf_net [get_bd_intf_pins roi_j_display/m_axi_result_mem] [get_bd_intf_pins roi_ddr_0/S12_AXI]
connect_bd_intf_net [get_bd_intf_pins roi_j_display/m_axi_rgb565_mem] [get_bd_intf_pins roi_ddr_1/S12_AXI]
connect_bd_intf_net [get_bd_intf_pins roi_k_depth/m_axi_video] [get_bd_intf_pins roi_ddr_0/S13_AXI]
connect_bd_intf_net [get_bd_intf_pins roi_k_depth/measurement] [get_bd_intf_pins roi_i_measure/disparity]
connect_bd_intf_net [get_bd_intf_pins rx_sof_expand_0/M_AXIS] [get_bd_intf_pins axis_dwidth_converter_0/S_AXIS]
connect_bd_intf_net [get_bd_intf_pins rx_sof_expand_1/M_AXIS] [get_bd_intf_pins axis_dwidth_converter_1/S_AXIS]
connect_bd_intf_net [get_bd_intf_pins smartconnect_0/M00_AXI] [get_bd_intf_pins processing_system7_0/S_AXI_HP1]
connect_bd_intf_net [get_bd_intf_pins smartconnect_1/M00_AXI] [get_bd_intf_pins axi_vdma_0/S_AXI_LITE]
connect_bd_intf_net [get_bd_intf_pins smartconnect_1/M01_AXI] [get_bd_intf_pins axi_vdma_2/S_AXI_LITE]
connect_bd_intf_net [get_bd_intf_pins smartconnect_1/M02_AXI] [get_bd_intf_pins axi_vdma_3/S_AXI_LITE]
connect_bd_intf_net [get_bd_intf_pins smartconnect_1/M03_AXI] [get_bd_intf_pins axi_vdma_1/S_AXI_LITE]
connect_bd_intf_net [get_bd_intf_pins smartconnect_1/M04_AXI] [get_bd_intf_pins axi_gpio_0/S_AXI]
connect_bd_intf_net [get_bd_intf_pins v_tc_0/ctrl] [get_bd_intf_pins smartconnect_1/M05_AXI]
connect_bd_intf_net [get_bd_intf_pins smartconnect_1/M06_AXI] [get_bd_intf_pins axi_dynclk_0/S_AXI_LITE]
connect_bd_intf_net [get_bd_intf_pins smartconnect_1/M07_AXI] [get_bd_intf_pins remap_operate_pipeli_0/s_axi]
connect_bd_intf_net [get_bd_intf_pins smartconnect_1/M08_AXI] [get_bd_intf_pins remap_generate_v1_0_0/s_axi]
connect_bd_intf_net [get_bd_intf_pins smartconnect_1/M09_AXI] [get_bd_intf_pins remap_operate_pipeli_1/s_axi]
connect_bd_intf_net [get_bd_intf_pins smartconnect_1/M10_AXI] [get_bd_intf_pins remap_generate_v1_0_1/s_axi]
connect_bd_intf_net [get_bd_intf_pins smartconnect_1/M11_AXI] [get_bd_intf_pins axi_vdma_4/S_AXI_LITE]
connect_bd_intf_net [get_bd_intf_pins axis_switch_0/S_AXI_CTRL] [get_bd_intf_pins smartconnect_1/M13_AXI]
connect_bd_intf_net [get_bd_intf_pins axis_switch_1/S_AXI_CTRL] [get_bd_intf_pins smartconnect_1/M14_AXI]
connect_bd_intf_net [get_bd_intf_pins smartconnect_1/M15_AXI] [get_bd_intf_pins overlay_ctrl/S00_AXI]
connect_bd_intf_net [get_bd_intf_pins smartconnect_2/M00_AXI] [get_bd_intf_pins processing_system7_0/S_AXI_HP0]
connect_bd_intf_net [get_bd_intf_pins processing_system7_0/S_AXI_HP2] [get_bd_intf_pins smartconnect_3/M00_AXI]
connect_bd_intf_net [get_bd_intf_pins smartconnect_4/M00_AXI] [get_bd_intf_pins processing_system7_0/S_AXI_HP3]
connect_bd_intf_net -intf_net stereo_match_v1_0_0_M_AXI [get_bd_intf_pins roi_ddr_0/M00_AXI] [get_bd_intf_pins smartconnect_3/S02_AXI]
connect_bd_intf_net [get_bd_intf_pins v_axi4s_vid_out_0/vid_io_out] [get_bd_intf_pins DVI_Transmitter_0/Video_In]
connect_bd_intf_net [get_bd_intf_pins v_osd_replacement_0/m_axis_video] [get_bd_intf_pins axis_switch_2/S00_AXIS]
connect_bd_intf_net [get_bd_intf_pins v_tc_0/vtiming_out] [get_bd_intf_pins v_axi4s_vid_out_0/vtiming_in]
connect_bd_net [get_bd_pins DVI_Transmitter_0/iic_scl] [get_bd_ports iic_scl]
connect_bd_net [get_bd_pins DVI_Transmitter_0/rstn_out] [get_bd_ports rstn_out]
connect_bd_net [get_bd_pins DVI_Transmitter_0/video_clk] [get_bd_ports video_clk]
connect_bd_net [get_bd_ports iic_sda] [get_bd_pins DVI_Transmitter_0/iic_sda]
connect_bd_net [get_bd_pins aurora_8b10b_0/m_axi_rx_tdata] [get_bd_pins axis_clock_converter_3/s_axis_tdata]
connect_bd_net [get_bd_pins aurora_8b10b_0/m_axi_rx_tkeep] [get_bd_pins axis_clock_converter_3/s_axis_tkeep]
connect_bd_net [get_bd_pins aurora_8b10b_0/m_axi_rx_tlast] [get_bd_pins axis_clock_converter_3/s_axis_tlast]
connect_bd_net [get_bd_pins aurora_8b10b_0/m_axi_rx_tvalid] [get_bd_pins rx_admission_ctrl_0/rx_valid]
connect_bd_net [get_bd_pins aurora_8b10b_0/sys_reset_out] \
  [get_bd_pins aurora_receive_reset_0/sys_reset_out] [get_bd_pins fpga2_ctrl_reset_0/sys_reset_out] \
  [get_bd_pins rx_admission_ctrl_0/sys_reset_out]
connect_bd_net [get_bd_pins aurora_8b10b_0/user_clk_out] \
  [get_bd_pins axis_clock_converter_3/s_axis_aclk] [get_bd_pins aurora_reset_ctrl_0/user_clk] \
  [get_bd_pins aurora_receive_reset_0/rx_clk] [get_bd_pins fpga2_ctrl_reset_0/clk] [get_bd_pins rx_admission_ctrl_0/rx_clk]
connect_bd_net [get_bd_pins aurora_receive_reset_0/rx_axis_aresetn] \
  [get_bd_pins axis_clock_converter_3/s_axis_aresetn] [get_bd_pins rx_admission_ctrl_0/rx_aresetn]
connect_bd_net [get_bd_pins aurora_receive_reset_0/video_axis_aresetn] \
  [get_bd_pins axis_clock_converter_3/m_axis_aresetn] [get_bd_pins axis_frame_decoder_0/rst_n] \
  [get_bd_pins axis_dwidth_converter_1/aresetn] [get_bd_pins axis_dwidth_converter_0/aresetn] \
  [get_bd_pins axis_subset_converter_0/aresetn] [get_bd_pins axis_subset_converter_1/aresetn] \
  [get_bd_pins rx_sof_expand_0/aresetn] [get_bd_pins rx_sof_expand_1/aresetn] [get_bd_pins fpga2_ctrl_reset_0/video_reset_n]
connect_bd_net [get_bd_pins aurora_reset_ctrl_0/aurora_gt_reset] [get_bd_pins aurora_8b10b_0/gt_reset]
connect_bd_net [get_bd_pins aurora_reset_ctrl_0/aurora_reset] [get_bd_pins aurora_8b10b_0/reset]
connect_bd_net [get_bd_pins axi_dynclk_0/LOCKED_O] [get_bd_pins proc_sys_reset_2/dcm_locked]
connect_bd_net [get_bd_pins axi_dynclk_0/PXL_CLK_O] \
  [get_bd_pins proc_sys_reset_2/slowest_sync_clk] [get_bd_pins v_axi4s_vid_out_0/vid_io_out_clk] [get_bd_pins v_tc_0/clk] \
  [get_bd_pins DVI_Transmitter_0/pixel_clk]
connect_bd_net [get_bd_pins axi_gpio_0/gpio_io_o] [get_bd_pins rx_admission_ctrl_0/sw_enable]
connect_bd_net [get_bd_pins axi_vdma_0/s2mm_introut] [get_bd_pins xlconcat_0/In3]
connect_bd_net [get_bd_pins axi_vdma_1/s2mm_introut] [get_bd_pins xlconcat_0/In2]
connect_bd_net [get_bd_pins axi_vdma_2/mm2s_introut] [get_bd_pins xlconcat_0/In0]
connect_bd_net [get_bd_pins axi_vdma_3/mm2s_introut] [get_bd_pins xlconcat_0/In1]
connect_bd_net [get_bd_pins axis_clock_converter_3/s_axis_tready] [get_bd_pins rx_admission_ctrl_0/fifo_ready]
# net axis_line_monitor_0_completed_lines has one end: axis_line_monitor_0/completed_lines
# net axis_line_monitor_0_event_flags has one end: axis_line_monitor_0/event_flags
# net axis_line_monitor_0_first_error_beats has one end: axis_line_monitor_0/first_error_beats
# net axis_line_monitor_0_first_error_flags has one end: axis_line_monitor_0/first_error_flags
# net axis_line_monitor_0_first_error_frame has one end: axis_line_monitor_0/first_error_frame
# net axis_line_monitor_0_first_error_line has one end: axis_line_monitor_0/first_error_line
# net axis_line_monitor_0_first_error_valid has one end: axis_line_monitor_0/first_error_valid
# net axis_line_monitor_0_frame_error_count has one end: axis_line_monitor_0/frame_error_count
# net axis_line_monitor_0_frame_index has one end: axis_line_monitor_0/frame_index
# net axis_line_monitor_0_keep_error_count has one end: axis_line_monitor_0/keep_error_count
# net axis_line_monitor_0_last_frame_lines has one end: axis_line_monitor_0/last_frame_lines
# net axis_line_monitor_0_long_count has one end: axis_line_monitor_0/long_count
# net axis_line_monitor_0_short_count has one end: axis_line_monitor_0/short_count
# net axis_line_monitor_0_sof_mid_count has one end: axis_line_monitor_0/sof_mid_count
# net axis_line_monitor_0_sticky_flags has one end: axis_line_monitor_0/sticky_flags
connect_bd_net -net channel_up [get_bd_pins aurora_8b10b_0/channel_up] \
  [get_bd_pins aurora_receive_reset_0/channel_up] [get_bd_pins fpga2_ctrl_reset_0/channel_up] \
  [get_bd_pins rx_admission_ctrl_0/channel_up]
# net fifo_read_level has one end: v_axi4s_vid_out_0/fifo_read_level
# net fpga2_ctrl_reset_0_debug_ready has one end: fpga2_ctrl_reset_0/debug_ready
connect_bd_net [get_bd_pins fpga2_ctrl_reset_0/m_axis_tvalid] [get_bd_pins aurora_8b10b_0/s_axi_tx_tvalid]
# net frame_err has one end: aurora_8b10b_0/frame_err
# net hard_err has one end: aurora_8b10b_0/hard_err
connect_bd_net [get_bd_pins hdmi_cfg_clk/clk_out1] [get_bd_pins hdmi_cfg_reset/slowest_sync_clk] [get_bd_pins DVI_Transmitter_0/cfg_clk]
connect_bd_net [get_bd_pins hdmi_cfg_clk/locked] [get_bd_pins hdmi_cfg_reset/dcm_locked]
connect_bd_net [get_bd_pins hdmi_cfg_reset/peripheral_aresetn] [get_bd_pins DVI_Transmitter_0/rst_n]
# net lane_up has one end: aurora_8b10b_0/lane_up
connect_bd_net [get_bd_pins line_monitor_control/probe_out0] \
  [get_bd_pins axis_line_monitor_0/clear] [get_bd_pins line_rx_right/clear] [get_bd_pins line_vdma_left/clear] \
  [get_bd_pins line_vdma_right/clear]
connect_bd_net [get_bd_pins line_monitor_keep/dout] [get_bd_pins axis_line_monitor_0/mon_tkeep] [get_bd_pins line_rx_right/mon_tkeep]
# net line_rx_right_completed_lines has one end: line_rx_right/completed_lines
# net line_rx_right_event_flags has one end: line_rx_right/event_flags
# net line_rx_right_first_error_beats has one end: line_rx_right/first_error_beats
# net line_rx_right_first_error_flags has one end: line_rx_right/first_error_flags
# net line_rx_right_first_error_frame has one end: line_rx_right/first_error_frame
# net line_rx_right_first_error_line has one end: line_rx_right/first_error_line
# net line_rx_right_first_error_valid has one end: line_rx_right/first_error_valid
# net line_rx_right_frame_error_count has one end: line_rx_right/frame_error_count
# net line_rx_right_frame_index has one end: line_rx_right/frame_index
# net line_rx_right_keep_error_count has one end: line_rx_right/keep_error_count
# net line_rx_right_last_frame_lines has one end: line_rx_right/last_frame_lines
# net line_rx_right_long_count has one end: line_rx_right/long_count
# net line_rx_right_short_count has one end: line_rx_right/short_count
# net line_rx_right_sof_mid_count has one end: line_rx_right/sof_mid_count
# net line_rx_right_sticky_flags has one end: line_rx_right/sticky_flags
# net line_vdma_left_completed_lines has one end: line_vdma_left/completed_lines
# net line_vdma_left_event_flags has one end: line_vdma_left/event_flags
# net line_vdma_left_first_error_beats has one end: line_vdma_left/first_error_beats
# net line_vdma_left_first_error_flags has one end: line_vdma_left/first_error_flags
# net line_vdma_left_first_error_frame has one end: line_vdma_left/first_error_frame
# net line_vdma_left_first_error_line has one end: line_vdma_left/first_error_line
# net line_vdma_left_first_error_valid has one end: line_vdma_left/first_error_valid
# net line_vdma_left_frame_error_count has one end: line_vdma_left/frame_error_count
# net line_vdma_left_frame_index has one end: line_vdma_left/frame_index
# net line_vdma_left_keep_error_count has one end: line_vdma_left/keep_error_count
# net line_vdma_left_last_frame_lines has one end: line_vdma_left/last_frame_lines
# net line_vdma_left_long_count has one end: line_vdma_left/long_count
# net line_vdma_left_short_count has one end: line_vdma_left/short_count
# net line_vdma_left_sof_mid_count has one end: line_vdma_left/sof_mid_count
# net line_vdma_left_sticky_flags has one end: line_vdma_left/sticky_flags
# net line_vdma_right_completed_lines has one end: line_vdma_right/completed_lines
# net line_vdma_right_event_flags has one end: line_vdma_right/event_flags
# net line_vdma_right_first_error_beats has one end: line_vdma_right/first_error_beats
# net line_vdma_right_first_error_flags has one end: line_vdma_right/first_error_flags
# net line_vdma_right_first_error_frame has one end: line_vdma_right/first_error_frame
# net line_vdma_right_first_error_line has one end: line_vdma_right/first_error_line
# net line_vdma_right_first_error_valid has one end: line_vdma_right/first_error_valid
# net line_vdma_right_frame_error_count has one end: line_vdma_right/frame_error_count
# net line_vdma_right_frame_index has one end: line_vdma_right/frame_index
# net line_vdma_right_keep_error_count has one end: line_vdma_right/keep_error_count
# net line_vdma_right_last_frame_lines has one end: line_vdma_right/last_frame_lines
# net line_vdma_right_long_count has one end: line_vdma_right/long_count
# net line_vdma_right_short_count has one end: line_vdma_right/short_count
# net line_vdma_right_sof_mid_count has one end: line_vdma_right/sof_mid_count
# net line_vdma_right_sticky_flags has one end: line_vdma_right/sticky_flags
# net pll_not_locked_out has one end: aurora_8b10b_0/pll_not_locked_out
connect_bd_net [get_bd_pins proc_sys_reset_0/interconnect_aresetn] [get_bd_pins smartconnect_0/aresetn] [get_bd_pins smartconnect_2/aresetn]
connect_bd_net [get_bd_pins proc_sys_reset_0/peripheral_aresetn] \
  [get_bd_pins axis_clock_converter_0/s_axis_aresetn] [get_bd_pins axis_clock_converter_1/s_axis_aresetn] \
  [get_bd_pins axis_clock_converter_2/m_axis_aresetn] [get_bd_pins axis_switch_0/aresetn] [get_bd_pins axis_switch_1/aresetn] \
  [get_bd_pins axis_switch_2/aresetn] [get_bd_pins v_axi4s_vid_out_0/aresetn] [get_bd_pins v_osd_replacement_0/aresetn] \
  [get_bd_pins axis_line_monitor_0/rst_n] [get_bd_pins line_rx_right/rst_n] [get_bd_pins line_vdma_left/rst_n] \
  [get_bd_pins line_vdma_right/rst_n]
connect_bd_net [get_bd_pins proc_sys_reset_1/interconnect_aresetn] \
  [get_bd_pins smartconnect_1/aresetn] [get_bd_pins overlay_ctrl/aresetn] [get_bd_pins roi_ddr_0/aresetn] \
  [get_bd_pins roi_ddr_1/aresetn]
connect_bd_net [get_bd_pins proc_sys_reset_1/peripheral_aresetn] \
  [get_bd_pins axi_dynclk_0/s_axi_lite_aresetn] [get_bd_pins axi_gpio_0/s_axi_aresetn] [get_bd_pins axi_vdma_0/axi_resetn] \
  [get_bd_pins axi_vdma_1/axi_resetn] [get_bd_pins axi_vdma_2/axi_resetn] [get_bd_pins axi_vdma_3/axi_resetn] \
  [get_bd_pins axi_vdma_4/axi_resetn] [get_bd_pins axis_clock_converter_0/m_axis_aresetn] \
  [get_bd_pins axis_clock_converter_1/m_axis_aresetn] [get_bd_pins axis_clock_converter_2/s_axis_aresetn] \
  [get_bd_pins axis_subset_converter_4/aresetn] [get_bd_pins axis_switch_0/s_axi_ctrl_aresetn] \
  [get_bd_pins axis_switch_1/s_axi_ctrl_aresetn] [get_bd_pins axis_switch_2/s_axi_ctrl_aresetn] \
  [get_bd_pins v_tc_0/s_axi_aresetn] [get_bd_pins aurora_reset_ctrl_0/rst_n] [get_bd_pins aurora_receive_reset_0/rst_n] \
  [get_bd_pins hdmi_cfg_clk/resetn] [get_bd_pins hdmi_cfg_reset/ext_reset_in] [get_bd_pins fpga2_ctrl_reset_0/rst_n] \
  [get_bd_pins roi_a_gray/ap_rst_n] [get_bd_pins roi_e_region/ap_rst_n] [get_bd_pins roi_g_supply/ap_rst_n] \
  [get_bd_pins roi_h_sgm/ap_rst_n] [get_bd_pins rx_admission_ctrl_0/rst_n] [get_bd_pins roi_i_measure/ap_rst_n] \
  [get_bd_pins roi_b_target/ap_rst_n] [get_bd_pins roi_c_contour/ap_rst_n] [get_bd_pins roi_j_display/ap_rst_n] \
  [get_bd_pins roi_d_overlay/ap_rst_n] [get_bd_pins roi_ui_gpio/s_axi_aresetn] [get_bd_pins roi_k_depth/ap_rst_n] \
  [get_bd_pins roi_mode_button_0/resetn]
connect_bd_net [get_bd_pins proc_sys_reset_2/peripheral_aresetn] [get_bd_pins v_tc_0/resetn]
connect_bd_net [get_bd_pins proc_sys_reset_2/peripheral_reset] [get_bd_pins v_axi4s_vid_out_0/vid_io_out_reset]
connect_bd_net [get_bd_pins proc_sys_reset_3/interconnect_aresetn] [get_bd_pins smartconnect_3/aresetn]
connect_bd_net [get_bd_pins proc_sys_reset_3/peripheral_aresetn] \
  [get_bd_pins remap_generate_v1_0_0/aresetn] [get_bd_pins remap_operate_pipeli_0/aresetn]
connect_bd_net [get_bd_pins proc_sys_reset_4/interconnect_aresetn] [get_bd_pins smartconnect_4/aresetn]
connect_bd_net [get_bd_pins proc_sys_reset_4/peripheral_aresetn] \
  [get_bd_pins remap_generate_v1_0_1/aresetn] [get_bd_pins remap_operate_pipeli_1/aresetn]
connect_bd_net [get_bd_pins processing_system7_0/FCLK_CLK0] \
  [get_bd_pins axi_dynclk_0/REF_CLK_I] [get_bd_pins axi_dynclk_0/s_axi_lite_aclk] [get_bd_pins axi_gpio_0/s_axi_aclk] \
  [get_bd_pins axi_vdma_0/s_axi_lite_aclk] [get_bd_pins axi_vdma_1/s_axi_lite_aclk] [get_bd_pins axi_vdma_2/s_axi_lite_aclk] \
  [get_bd_pins axi_vdma_3/s_axi_lite_aclk] [get_bd_pins axi_vdma_4/s_axi_lite_aclk] [get_bd_pins axi_vdma_4/m_axi_mm2s_aclk] \
  [get_bd_pins axi_vdma_4/m_axis_mm2s_aclk] [get_bd_pins axis_clock_converter_0/m_axis_aclk] \
  [get_bd_pins axis_clock_converter_1/m_axis_aclk] [get_bd_pins axis_clock_converter_2/s_axis_aclk] \
  [get_bd_pins axis_subset_converter_4/aclk] [get_bd_pins axis_switch_0/s_axi_ctrl_aclk] \
  [get_bd_pins axis_switch_1/s_axi_ctrl_aclk] [get_bd_pins axis_switch_2/s_axi_ctrl_aclk] \
  [get_bd_pins proc_sys_reset_1/slowest_sync_clk] [get_bd_pins proc_sys_reset_3/slowest_sync_clk] \
  [get_bd_pins proc_sys_reset_4/slowest_sync_clk] [get_bd_pins processing_system7_0/M_AXI_GP0_ACLK] \
  [get_bd_pins processing_system7_0/S_AXI_HP2_ACLK] [get_bd_pins processing_system7_0/S_AXI_HP3_ACLK] \
  [get_bd_pins remap_generate_v1_0_0/aclk] [get_bd_pins remap_generate_v1_0_1/aclk] [get_bd_pins remap_operate_pipeli_0/aclk] \
  [get_bd_pins remap_operate_pipeli_1/aclk] [get_bd_pins smartconnect_1/aclk] [get_bd_pins smartconnect_3/aclk] \
  [get_bd_pins smartconnect_4/aclk] [get_bd_pins v_tc_0/s_axi_aclk] [get_bd_pins aurora_8b10b_0/init_clk_in] \
  [get_bd_pins aurora_8b10b_0/drpclk_in] [get_bd_pins aurora_reset_ctrl_0/init_clk] [get_bd_pins hdmi_cfg_clk/clk_in1] \
  [get_bd_pins overlay_ctrl/aclk] [get_bd_pins roi_a_gray/ap_clk] [get_bd_pins roi_e_region/ap_clk] \
  [get_bd_pins roi_g_supply/ap_clk] [get_bd_pins roi_h_sgm/ap_clk] [get_bd_pins roi_ddr_0/aclk] [get_bd_pins roi_ddr_1/aclk] \
  [get_bd_pins rx_admission_ctrl_0/ctrl_clk] [get_bd_pins roi_i_measure/ap_clk] [get_bd_pins roi_b_target/ap_clk] \
  [get_bd_pins roi_c_contour/ap_clk] [get_bd_pins roi_j_display/ap_clk] [get_bd_pins roi_d_overlay/ap_clk] \
  [get_bd_pins roi_ui_gpio/s_axi_aclk] [get_bd_pins roi_k_depth/ap_clk] [get_bd_pins roi_mode_button_0/clk]
connect_bd_net [get_bd_pins processing_system7_0/FCLK_CLK1] \
  [get_bd_pins axi_vdma_0/m_axi_s2mm_aclk] [get_bd_pins axi_vdma_0/s_axis_s2mm_aclk] [get_bd_pins axi_vdma_1/m_axi_s2mm_aclk] \
  [get_bd_pins axi_vdma_1/s_axis_s2mm_aclk] [get_bd_pins axi_vdma_2/m_axi_mm2s_aclk] \
  [get_bd_pins axi_vdma_2/m_axis_mm2s_aclk] [get_bd_pins axi_vdma_3/m_axi_mm2s_aclk] \
  [get_bd_pins axi_vdma_3/m_axis_mm2s_aclk] [get_bd_pins axis_clock_converter_0/s_axis_aclk] \
  [get_bd_pins axis_clock_converter_1/s_axis_aclk] [get_bd_pins axis_clock_converter_2/m_axis_aclk] \
  [get_bd_pins axis_subset_converter_0/aclk] [get_bd_pins axis_subset_converter_1/aclk] \
  [get_bd_pins axis_subset_converter_2/aclk] [get_bd_pins axis_subset_converter_3/aclk] [get_bd_pins axis_switch_0/aclk] \
  [get_bd_pins axis_switch_1/aclk] [get_bd_pins axis_switch_2/aclk] [get_bd_pins proc_sys_reset_0/slowest_sync_clk] \
  [get_bd_pins processing_system7_0/S_AXI_HP0_ACLK] [get_bd_pins processing_system7_0/S_AXI_HP1_ACLK] \
  [get_bd_pins smartconnect_0/aclk] [get_bd_pins smartconnect_2/aclk] [get_bd_pins v_axi4s_vid_out_0/aclk] \
  [get_bd_pins v_osd_replacement_0/aclk] [get_bd_pins axis_clock_converter_3/m_axis_aclk] \
  [get_bd_pins axis_frame_decoder_0/clk] [get_bd_pins aurora_receive_reset_0/video_clk] \
  [get_bd_pins axis_dwidth_converter_1/aclk] [get_bd_pins axis_dwidth_converter_0/aclk] [get_bd_pins rx_sof_expand_0/aclk] \
  [get_bd_pins rx_sof_expand_1/aclk] [get_bd_pins line_monitor_control/clk] [get_bd_pins axis_line_monitor_0/clk] \
  [get_bd_pins line_rx_right/clk] [get_bd_pins line_vdma_left/clk] [get_bd_pins line_vdma_right/clk]
connect_bd_net [get_bd_pins processing_system7_0/FCLK_RESET0_N] \
  [get_bd_pins proc_sys_reset_0/ext_reset_in] [get_bd_pins proc_sys_reset_1/ext_reset_in] \
  [get_bd_pins proc_sys_reset_2/ext_reset_in] [get_bd_pins proc_sys_reset_3/ext_reset_in] \
  [get_bd_pins proc_sys_reset_4/ext_reset_in]
connect_bd_net [get_bd_pins roi_mode_button_0/alarm_led] [get_bd_ports roi_alarm_led]
connect_bd_net [get_bd_pins roi_mode_button_0/mode_depth] [get_bd_pins roi_ui_gpio/gpio_io_i]
connect_bd_net [get_bd_ports roi_mode_key_n] [get_bd_pins roi_mode_button_0/key_n]
connect_bd_net [get_bd_pins roi_ui_gpio/gpio2_io_o] [get_bd_pins roi_mode_button_0/alarm_enable]
connect_bd_net [get_bd_pins rx_admission_ctrl_0/admitted_valid] [get_bd_pins axis_clock_converter_3/s_axis_tvalid]
connect_bd_net [get_bd_pins rx_admission_ctrl_0/clear_req] [get_bd_pins aurora_receive_reset_0/clear_req]
connect_bd_net [get_bd_pins rx_admission_ctrl_0/receiver_ready] [get_bd_pins fpga2_ctrl_reset_0/receiver_ready]
connect_bd_net [get_bd_pins rx_admission_ctrl_0/status] [get_bd_pins axi_gpio_0/gpio2_io_i]
# net rx_resetdone_out has one end: aurora_8b10b_0/rx_resetdone_out
# net soft_err has one end: aurora_8b10b_0/soft_err
# net stream_unused_zero_dout has one end: stream_unused_zero/dout
# net tx_lock has one end: aurora_8b10b_0/tx_lock
# net tx_resetdone_out has one end: aurora_8b10b_0/tx_resetdone_out
connect_bd_net [get_bd_pins v_axi4s_vid_out_0/vtg_ce] [get_bd_pins v_tc_0/gen_clken]
connect_bd_net [get_bd_pins v_tc_0/irq] [get_bd_pins xlconcat_0/In4]
connect_bd_net [get_bd_pins xlconcat_0/dout] [get_bd_pins processing_system7_0/IRQ_F2P]
# net xlconstant_0_dout has one end: xlconstant_0/dout
connect_bd_net [get_bd_pins xlconstant_10/dout] [get_bd_pins aurora_8b10b_0/drpwe_in]
connect_bd_net [get_bd_pins xlconstant_11/dout] [get_bd_pins aurora_reset_ctrl_0/restart_req]
connect_bd_net [get_bd_pins xlconstant_12/dout] [get_bd_pins aurora_reset_ctrl_0/clk_locked]
connect_bd_net [get_bd_pins xlconstant_13/dout] [get_bd_pins hdmi_cfg_reset/aux_reset_in] [get_bd_pins hdmi_cfg_reset/mb_debug_sys_rst]
connect_bd_net [get_bd_pins xlconstant_14/dout] [get_bd_ports sfpa_tx_disable]
# net xlconstant_1_dout has one end: xlconstant_1/dout
connect_bd_net [get_bd_pins xlconstant_2/dout] [get_bd_pins axis_subset_converter_2/aresetn]
connect_bd_net [get_bd_pins xlconstant_3/dout] [get_bd_pins axis_subset_converter_3/aresetn]
connect_bd_net [get_bd_pins xlconstant_4/dout] [get_bd_pins v_osd_replacement_0/aclken]
connect_bd_net [get_bd_pins xlconstant_5/dout] [get_bd_pins aurora_8b10b_0/loopback]
connect_bd_net [get_bd_pins xlconstant_6/dout] [get_bd_pins aurora_8b10b_0/power_down]
connect_bd_net [get_bd_pins xlconstant_7/dout] [get_bd_pins aurora_8b10b_0/drpaddr_in]
connect_bd_net [get_bd_pins xlconstant_8/dout] [get_bd_pins aurora_8b10b_0/drpdi_in]
connect_bd_net [get_bd_pins xlconstant_9/dout] [get_bd_pins aurora_8b10b_0/drpen_in]
